# EasyEDA Pro project d2-afe-development.epro, schematic Schematic1_1

## Sheets
1 ads1298: Board Name: Board1; Create Date: 2026-01-05; Page Name: P1; Project Name: ads1298; Schematic Name: Schematic1; Update Date: 2026-01-05; BladeWidth: 10; Company: 嘉立创EDA; Page Size: A4; RegionStart: 1; ShowBorder: 1; TitleBlock: 0; TitleBlockPosition: 3; Version: V1.0; XRegionCount: 6; YRegionCount: 4
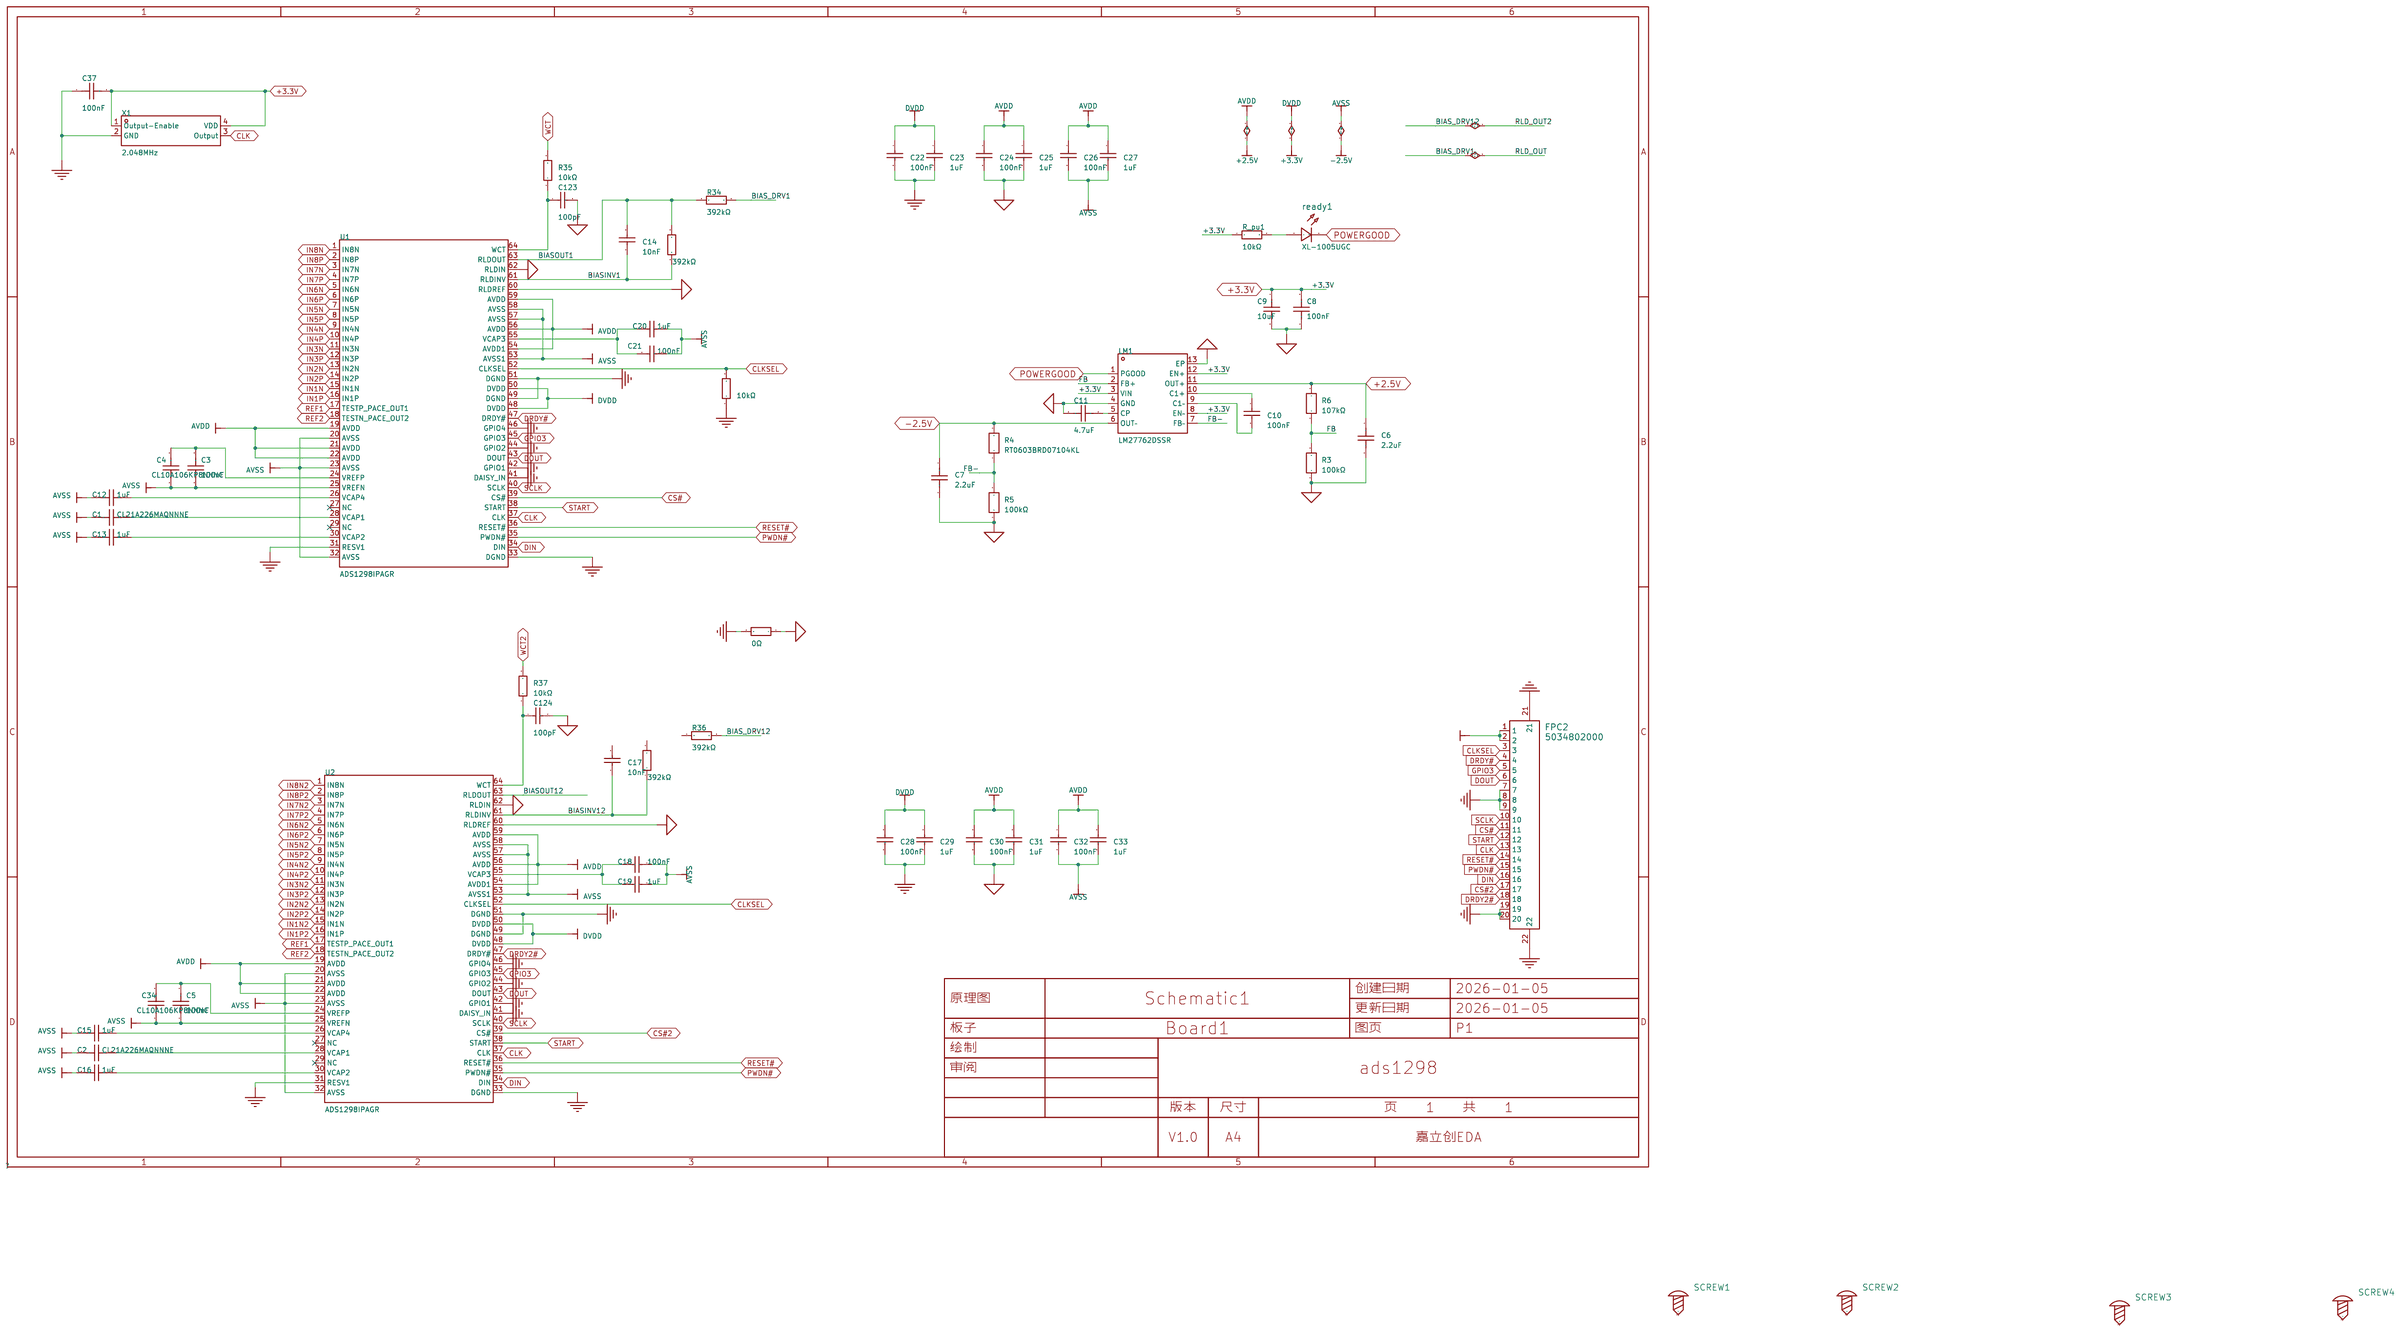
[diagram p0: ads1298]
2 power: Assembly Variant: Basic; Create Date: 2026-01-14; Update Date: 2026-01-14
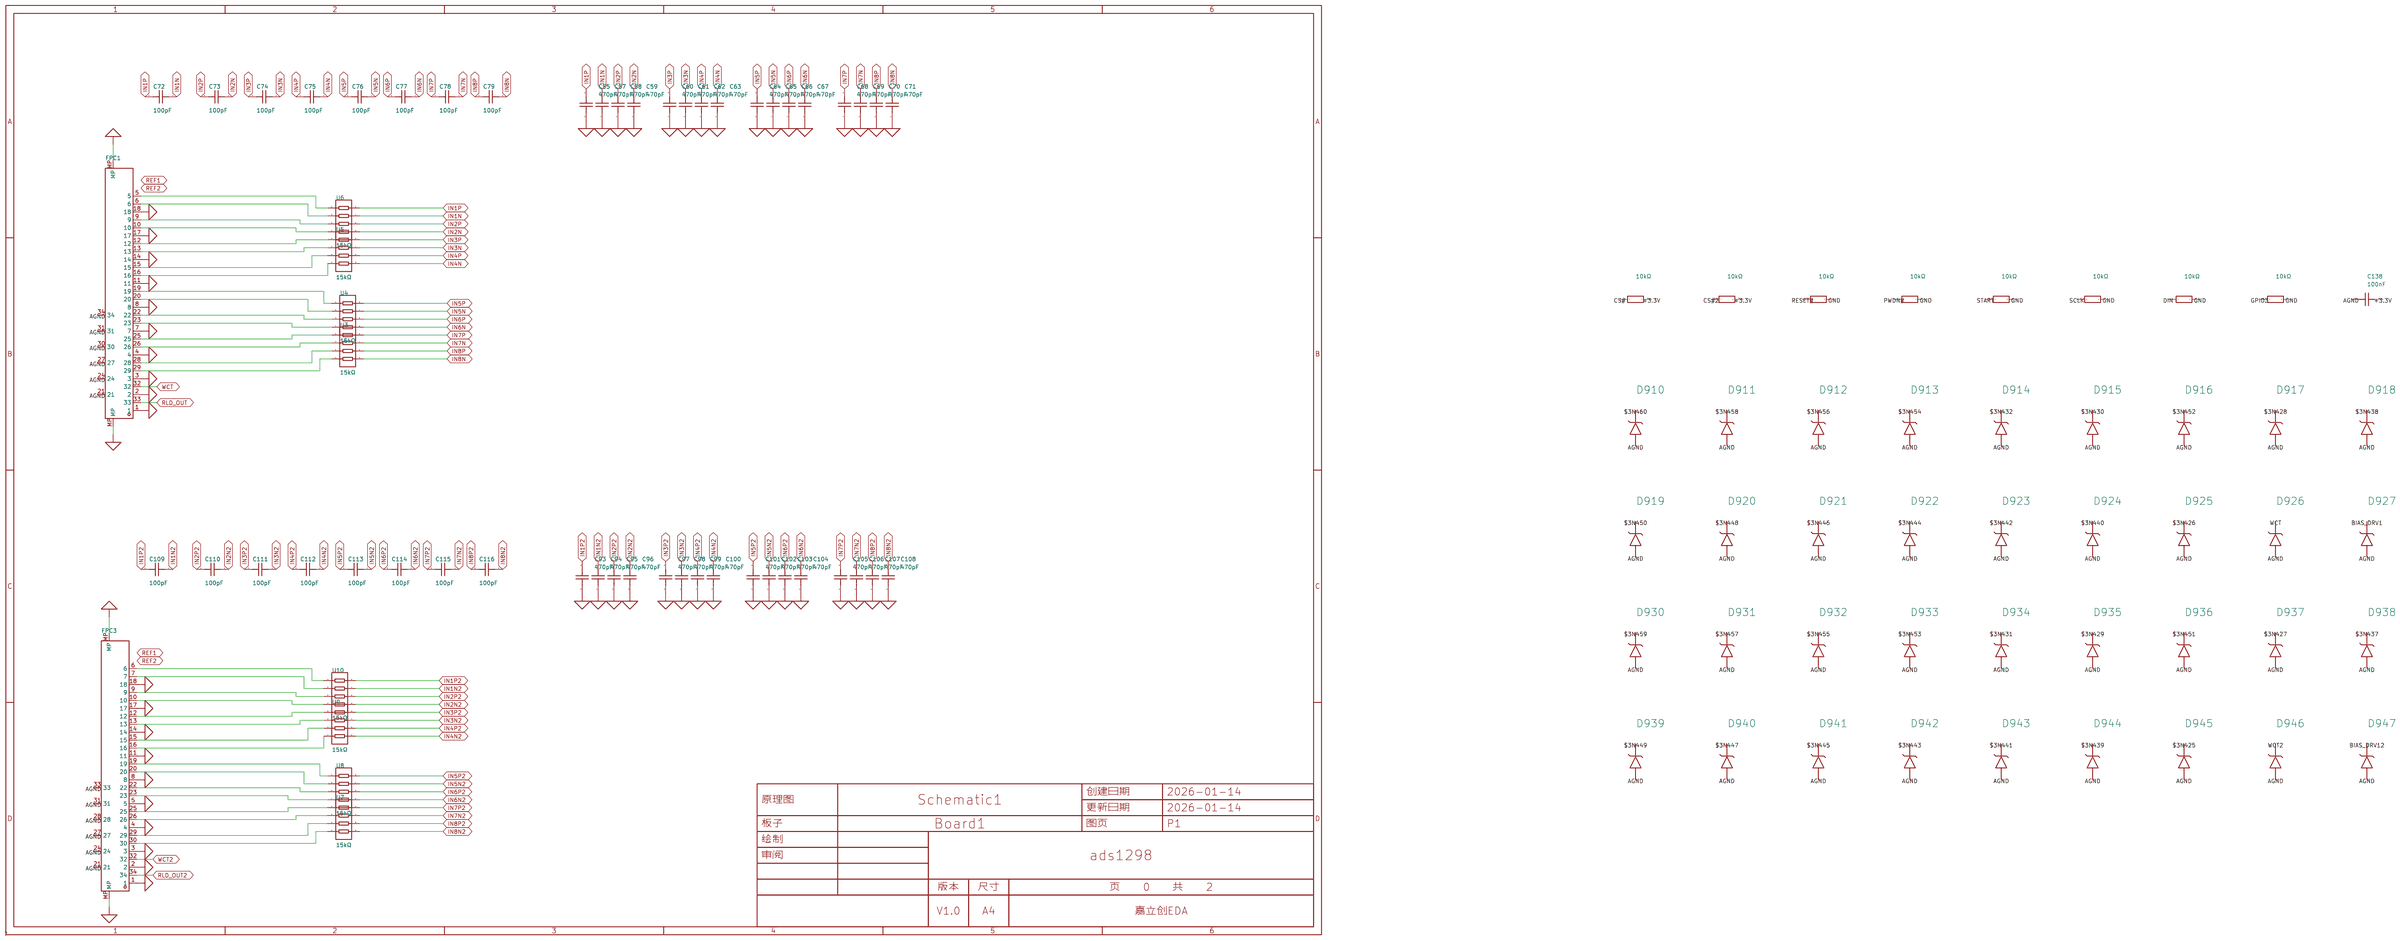
[diagram p1: power]

## Parts
sheet ads1298
C1  22uF  [C08A:V4_C54]
C2  22uF  [C08A:V4_C54]
C3  100nF  [C0402]
C4  10uF  [C08A:V4_C46]
C5  100nF  [C0402]
C6  2.2uF  [C0402]
C7  2.2uF  [C0402]
C8  100nF  [C0402]
C9  10uF  [C0402]
C10  100nF  [C0402]
C11  4.7uF  [C0402]
C12  1uF  [C0402]
C13  1uF  [C0402]
C14  10nF  [C0402]
C15  1uF  [C0402]
C16  1uF  [C0402]
C17  10nF  [C0402]
C18  100nF  [C0402]
C19  1uF  [C0402]
C20  1uF  [C0402]
C21  100nF  [C0402]
C22  100nF  [C0402]
C23  1uF  [C0402]
C24  100nF  [C0402]
C25  1uF  [C0402]
C26  100nF  [C0402]
C27  1uF  [C0402]
C28  100nF  [C0402]
C29  1uF  [C0402]
C30  100nF  [C0402]
C31  1uF  [C0402]
C32  100nF  [C0402]
C33  1uF  [C0402]
C34  10uF  [C08A:V4_C46]
C37  100nF  [C0402]
C123  100pF  [C0402]
C124  100pF  [C0402]
FPC2  5034802000  [FPC-SMD_5034802000]
LM1  LM27762DSSR  [WSON-12_L3.0-W2.0-P0.50-BL-EP]
R1  0Ω  [R0402]
R3  100kΩ  [R0402]
R4  104kΩ  [C08A:V4_R29]
R5  100kΩ  [R0402]
R6  107kΩ  [R0402]
R17  10kΩ  [R0402]
R24  392kΩ  [R0402]
R32  392kΩ  [R0402]
R34  392kΩ  [R0402]
R35  10kΩ  [R0402]
R36  392kΩ  [R0402]
R37  10kΩ  [R0402]
R_pu1  10kΩ  [R0402]
ready1  XL-1005UGC  [LED0402-RD_GREEN-1]
SCREW1  -  [M2螺丝]
SCREW2  -  [M2螺丝]
SCREW3  -  [M2螺丝]
SCREW4  -  [M2螺丝]
U1  ADS1298IPAGR  [TQFP-64_L10.0-W10.0-P0.50-LS12.0-BL]
U2  ADS1298IPAGR  [TQFP-64_L10.0-W10.0-P0.50-LS12.0-BL]
X1  2.048MHz  [OSC-SMD_4P-L1.6-W1.2-BL]
sheet power
C55  470pF  [C0201]
C57  470pF  [C0201]
C58  470pF  [C0201]
C59  470pF  [C0201]
C60  470pF  [C0201]
C61  470pF  [C0201]
C62  470pF  [C0201]
C63  470pF  [C0201]
C64  470pF  [C0201]
C65  470pF  [C0201]
C66  470pF  [C0201]
C67  470pF  [C0201]
C68  470pF  [C0201]
C69  470pF  [C0201]
C70  470pF  [C0201]
C71  470pF  [C0201]
C72  100pF  [C0201]
C73  100pF  [C0201]
C74  100pF  [C0201]
C75  100pF  [C0201]
C76  100pF  [C0201]
C77  100pF  [C0201]
C78  100pF  [C0201]
C79  100pF  [C0201]
C93  470pF  [C0201]
C94  470pF  [C0201]
C95  470pF  [C0201]
C96  470pF  [C0201]
C97  470pF  [C0201]
C98  470pF  [C0201]
C99  470pF  [C0201]
C100  470pF  [C0201]
C101  470pF  [C0201]
C102  470pF  [C0201]
C103  470pF  [C0201]
C104  470pF  [C0201]
C105  470pF  [C0201]
C106  470pF  [C0201]
C107  470pF  [C0201]
C108  470pF  [C0201]
C109  100pF  [C0201]
C110  100pF  [C0201]
C111  100pF  [C0201]
C112  100pF  [C0201]
C113  100pF  [C0201]
C114  100pF  [C0201]
C115  100pF  [C0201]
C116  100pF  [C0201]
C138  100nF  [C0402]
D910  ESD401DPYR  [C08A:D910]
D911  ESD401DPYR  [C08A:D910]
D912  ESD401DPYR  [C08A:D910]
D913  ESD401DPYR  [C08A:D910]
D914  ESD401DPYR  [C08A:D910]
D915  ESD401DPYR  [C08A:D910]
D916  ESD401DPYR  [C08A:D910]
D917  ESD401DPYR  [C08A:D910]
D918  ESD401DPYR  [C08A:D910]
D919  ESD401DPYR  [C08A:D910]
D920  ESD401DPYR  [C08A:D910]
D921  ESD401DPYR  [C08A:D910]
D922  ESD401DPYR  [C08A:D910]
D923  ESD401DPYR  [C08A:D910]
D924  ESD401DPYR  [C08A:D910]
D925  ESD401DPYR  [C08A:D910]
D926  ESD401DPYR  [C08A:D910]
D927  ESD401DPYR  [C08A:D910]
D930  ESD401DPYR  [C08A:D910]
D931  ESD401DPYR  [C08A:D910]
D932  ESD401DPYR  [C08A:D910]
D933  ESD401DPYR  [C08A:D910]
D934  ESD401DPYR  [C08A:D910]
D935  ESD401DPYR  [C08A:D910]
D936  ESD401DPYR  [C08A:D910]
D937  ESD401DPYR  [C08A:D910]
D938  ESD401DPYR  [C08A:D910]
D939  ESD401DPYR  [C08A:D910]
D940  ESD401DPYR  [C08A:D910]
D941  ESD401DPYR  [C08A:D910]
D942  ESD401DPYR  [C08A:D910]
D943  ESD401DPYR  [C08A:D910]
D944  ESD401DPYR  [C08A:D910]
D945  ESD401DPYR  [C08A:D910]
D946  ESD401DPYR  [C08A:D910]
D947  ESD401DPYR  [C08A:D910]
FPC1  FH34SRJ-34S-0.5SH(50)  [Hirose_FH34SRJ-34S-0.5SH]
FPC3  FH34SRJ-34S-0.5SH(50)  [Hirose_FH34SRJ-34S-0.5SH]
R801  10kΩ  [R0402]
R802  10kΩ  [R0402]
R803  10kΩ  [R0402]
R804  10kΩ  [R0402]
R805  10kΩ  [R0402]
R806  10kΩ  [R0402]
R807  10kΩ  [R0402]
R808  10kΩ  [R0402]
U3  15kΩ  [RES-ARRAY-SMD_0402-8P-L2.0-W1.0-BL]
U4  15kΩ  [RES-ARRAY-SMD_0402-8P-L2.0-W1.0-BL]
U5  15kΩ  [RES-ARRAY-SMD_0402-8P-L2.0-W1.0-BL]
U6  15kΩ  [RES-ARRAY-SMD_0402-8P-L2.0-W1.0-BL]
U7  15kΩ  [RES-ARRAY-SMD_0402-8P-L2.0-W1.0-BL]
U8  15kΩ  [RES-ARRAY-SMD_0402-8P-L2.0-W1.0-BL]
U9  15kΩ  [RES-ARRAY-SMD_0402-8P-L2.0-W1.0-BL]
U10  15kΩ  [RES-ARRAY-SMD_0402-8P-L2.0-W1.0-BL]

## Library data of the parts
C1 C2 = CL21A226MAQNNNE: Supplier Footprint: 0805; Supplier Part: C45783; Manufacturer: Samsung; Datasheet: https://www.lcsc.com/product-detail/C45783.html
C3 C5 C8 C37 C138 = CL05B104KO5NNNC: CL05B104KO5NNNC 100nF 0402; Supplier Footprint: 0402; Supplier Part: C1525; Supplier: LCSC; Datasheet: https://www.lcsc.com/product-detail/C1525.html; Manufacturer: Samsung; LCSC Part Name: 100nF 0402; Tolerance: ±10%; Voltage Rating: 16V; Temperature Coefficient: X7R
C4 C34 = CL10A106KP8NNNC: Supplier Footprint: 0603; Supplier Part: C19702; Manufacturer: Samsung; Datasheet: https://www.lcsc.com/product-detail/C19702.html
C6 C7 = CL05A225KO5NQNC: 容值:2.2uF;精度:±10%;额定电压:16V;温度系数:X5R;; LCSC Part Name: 2.2uF ±10% 16V; Supplier Part: C170151; Manufacturer: SAMSUNG(三星); Supplier Footprint: 0402; JLCPCB Part Class: Extended Part; Datasheet: https://item.szlcsc.com/datasheet/CL05A225KO5NQNC/181536.html; Supplier: LCSC; Tolerance: ±10%; Voltage Rating: 16V; Temperature Coefficient: X5R
C9 = HGC0402R5106M100NTEJ: HGC0402R5106M100NTEJ 10uF 0402; Supplier Footprint: 0402; Supplier Part: C7472949; Supplier: LCSC; Datasheet: https://www.lcsc.com/product-detail/C7472949.html; LCSC Part Name: 10uF 0402; Tolerance: ±20%; Voltage Rating: 10V; Temperature Coefficient: X5R
C10 C18 C21 C22 C24 C26 C28 C30 C32 = CL05B104KO5NNNC: CL05B104KO5NNNC 100nF 0402; LCSC Part Name: 100nF 0402; Supplier Part: C1525; Manufacturer: Samsung; Supplier Footprint: 0402; Datasheet: https://www.lcsc.com/product-detail/C1525.html; Supplier: LCSC; Tolerance: ±10%; Voltage Rating: 16V; Temperature Coefficient: X7R
C11 = CL05A475KP5NRNC: CL05A475KP5NRNC 4.7uF 0402; LCSC Part Name: 4.7uF 0402; Supplier Part: C368809; Manufacturer: Samsung; Supplier Footprint: 0402; Datasheet: https://www.lcsc.com/product-detail/C368809.html; Supplier: LCSC; Tolerance: ±10%; Voltage Rating: 10V; Temperature Coefficient: X5R
C12 C13 C15 C16 = CL05A105KA5NQNC: CL05A105KA5NQNC 1uF 0402; Supplier Footprint: 0402; Supplier Part: C52923; Supplier: LCSC; Datasheet: https://www.lcsc.com/product-detail/C52923.html; Manufacturer: Samsung; LCSC Part Name: 1uF 0402; Tolerance: ±10%; Voltage Rating: 25V; Temperature Coefficient: X5R
C14 C17 = 0402B103K500NT: 0402B103K500NT 10nF 0402; LCSC Part Name: 10nF 0402; Supplier Part: C1524; Manufacturer: FH; Supplier Footprint: 0402; Datasheet: https://www.lcsc.com/product-detail/C1524.html; Supplier: LCSC; Tolerance: ±10%; Voltage Rating: 50V; Temperature Coefficient: X7R
C19 C20 C23 C25 C27 C29 C31 C33 = CL05A105KA5NQNC: CL05A105KA5NQNC 1uF 0402; LCSC Part Name: 1uF 0402; Supplier Part: C52923; Manufacturer: Samsung; Supplier Footprint: 0402; Datasheet: https://www.lcsc.com/product-detail/C52923.html; Supplier: LCSC; Tolerance: ±10%; Voltage Rating: 25V; Temperature Coefficient: X5R
C123 C124 = 0402CG101J500NT: 容值:100pF;精度:±5%;额定电压:50V;温度系数:C0G;; LCSC Part Name: 100pF ±5% 50V; Supplier Part: C1546; Manufacturer: FH(风华); Supplier Footprint: 0402; JLCPCB Part Class: Basic Part; Datasheet: https://item.szlcsc.com/datasheet/0402CG101J500NT/1898.html; Supplier: LCSC; Tolerance: ±5%; Voltage Rating: 50V; Temperature Coefficient: C0G
FPC2 = 5034802000: 锁定特性:翻盖式;触点类型:双侧触点/上下接;触点数量:20P;间距:0.5mm;安装方式:卧贴;工作温度:-40℃~+85℃;; LCSC Part Name: 翻盖式 双侧触点/上下接 P数:20P 间距:0.5mm; Supplier Part: C234192; Manufacturer: MOLEX; Supplier Footprint: SMD,P=0.5mm,卧贴; JLCPCB Part Class: Extended Part; Datasheet: https://www.molex.com/content/dam/molex/molex-dot-com/products/automated/en-us/salesdrawingpdf/503/503480/5034802000_sd.pdf?inline; Supplier: LCSC; Locking Feature: 翻盖式; Contact Type: 双侧触点/上下接; Number of Contacts: 20P; Pitch: 0.5mm; Mounting Type: 卧贴; FFC, FCB Thickness: 0.3mm; Height Above Board: 1mm; Contact Material: 磷青铜; Contact Plating: 金; Operating Temperature: -40℃~+85℃; Rated Voltage (Max): 50V; Current Rating (Max): 500mA
LM1 = LM27762DSSR: LM27762 带有集成 LDO 的低噪声正负输出电荷泵; LCSC Part Name: 低噪声正负输出集成电荷泵加LDO; Supplier Part: C473398; Manufacturer: TI(德州仪器); Supplier Footprint: WSON-12-EP(2x3); JLCPCB Part Class: 扩展库; Datasheet: https://www.ti.com/cn/lit/gpn/lm27762; Supplier: LCSC
R1 = 0402WGF0000TCE: 0402WGF0000TCE 0Ω 0402; Supplier Footprint: 0402; Supplier Part: C17168; Supplier: LCSC; Datasheet: https://www.lcsc.com/product-detail/C17168.html; Manufacturer: UNI-ROYAL; LCSC Part Name: 0Ω 0402
R3 R5 = RT0402BRD07100KL: 电阻类型:薄膜电阻;阻值:100kΩ;精度:±0.1%;功率:62.5mW;最大工作电压:50V;温度系数:±25ppm/℃;; LCSC Part Name: 薄膜电阻 100kΩ ±0.1% 62.5mW; Supplier Part: C852472; Manufacturer: YAGEO(国巨); Supplier Footprint: 0402; JLCPCB Part Class: Extended Part; Datasheet: https://atta.szlcsc.com/upload/public/pdf/source/20210326/C852472_6283D268A9C33EA67274729CC55E28B1.pdf; Supplier: LCSC; Type: 薄膜电阻; Tolerance: ±0.1%; Power(Watts): 62.5mW; Overload Voltage (Max): 50V; Temperature Coefficient: ±25ppm/℃; Operating Temperature Range: -55℃~+155℃
R4 = RT0603BRD07104KL: Supplier Part: C861070; Manufacturer: YAGEO; Supplier Footprint: 0603; Datasheet: https://www.lcsc.com/product-detail/C861070.html; Supplier: LCSC; Type: 薄膜电阻; Tolerance: ±0.1%; Overload Voltage (Max): 50V; Operating Temperature Range: -55℃~+155℃
R6 = RT0402BRD07107KL: RT0402BRD07107KL 107kΩ 0402; LCSC Part Name: 107kΩ 0402; Supplier Part: C852477; Manufacturer: YAGEO; Supplier Footprint: 0402; Datasheet: https://www.lcsc.com/product-detail/C852477.html; Supplier: LCSC; Type: 薄膜电阻; Tolerance: ±0.1%; Overload Voltage (Max): 50V; Operating Temperature Range: -55℃~+155℃
R17 R35 R37 R801-R808 = 0402WGF1002TCE: 0402WGF1002TCE 10kΩ 0402; Supplier Footprint: 0402; Supplier Part: C25744; Supplier: LCSC; Datasheet: https://www.lcsc.com/product-detail/C25744.html; Manufacturer: UNI-ROYAL; LCSC Part Name: 10kΩ 0402; Tolerance: ±1%
R24 R32 R34 R36 = 0402WGF3923TCE: 0402WGF3923TCE 392kΩ 0402; Supplier Footprint: 0402; Supplier Part: C27007; Supplier: LCSC; Datasheet: https://www.lcsc.com/product-detail/C27007.html; Manufacturer: UNI-ROYAL; LCSC Part Name: 392kΩ 0402; Tolerance: ±1%
R_pu1 = 0402WGF1002TCE: 0402WGF1002TCE 10kΩ 0402; LCSC Part Name: 10kΩ 0402; Supplier Part: C25744; Manufacturer: UNI-ROYAL; Supplier Footprint: 0402; Datasheet: https://www.lcsc.com/product-detail/C25744.html; Supplier: LCSC; Type: 厚膜电阻; Tolerance: ±1%
ready1 = XL-1005UGC_C965793: 发光颜色:翠绿色;正向压降(Vf):3V;功率:80mW;正向电流:25mA;波长:516nm~531nm;透镜颜色:无色透明透镜;色温:-;发光强度:249mcd;发光角度:120°;载带方式:正贴;工作温度:-40℃~+85℃;; LCSC Part Name: 0402翠绿贴片式发光二极管; Supplier Part: C965793; Manufacturer: XINGLIGHT(成兴光); Supplier Footprint: 0402; JLCPCB Part Class: Extended Part; Datasheet: https://item.szlcsc.com/datasheet/XL-1005UGC/1051402.html; Supplier: LCSC; Illumination Color: 翠绿色; Voltage - Forward(Vf): 3V; Power(Watts): 80mW; Forward Current: 25mA; Wavelength - Dominant: 516nm~531nm; Peak Wavelength: 531nm; Lens Color: 无色透明透镜; Luminous Intensity: 249mcd; Viewing Angle: 120°; Mounting Style: 正贴; Operating Temperature: -40℃~+85℃
SCREW1-SCREW4 = M2螺丝: Supplier Footprint: 插件
U1 U2 = ADS1298IPAGR: 电源电压:1.65V~3.6V；2.7V~5.5V;; LCSC Part Name: ADS1298R低功耗8通道24bit 生物电bit 测量模拟前端; Supplier Part: C527440; Manufacturer: TI(德州仪器); Supplier Footprint: TQFP-64(10x10); JLCPCB Part Class: 扩展库; Datasheet: https://www.ti.com/cn/lit/gpn/ads1298; Supplier: LCSC; Supply Voltage: 1.65V~3.6V；2.7V~5.5V
X1 = SWOFCVXXE8-2.048000: 频率:2.048MHz;输出模式:CMOS;工作电压:1.8V~3.3V;供电电流:10mA;频率稳定度:±25ppm;; Supplier Part: C22368484; Manufacturer: Starwave(思大); Supplier Footprint: SMD1612-4P; JLCPCB Part Class: Extended Part; Datasheet: https://atta.szlcsc.com/upload/public/pdf/source/20240327/D858014EAF94412D0C19E3A7F15830C6.pdf; Supplier: LCSC; Output Type: CMOS; Supply Voltage: 1.8V~3.3V; Supply Current (Max): 10mA; Frequency Stability: ±25ppm; Operating Temperature: -40℃~+85℃
C55 C57-C71 C93-C108 = GRM0335C1E471GA01D: 容值:470pF;精度:±2%;额定电压:25V;材质(温度系数):C0G;; LCSC Part Name: 470pF ±2% 25V; Supplier Part: C384950; Manufacturer: muRata(村田); Supplier Footprint: 0201; JLCPCB Part Class: Extended Part; Datasheet: https://atta.szlcsc.com/upload/public/pdf/source/20200305/C490387_23319AE8C154DEB24C505E6C82A8106A.pdf; Supplier: LCSC; Tolerance: ±2%; Voltage Rated: 25V; Temperature Coefficient: C0G
C72-C79 C109-C116 = GRM0335C1H101JA01D: GRM0335C1H101JA01D 100pF 0201; LCSC Part Name: 100pF 0201; Supplier Part: C76922; Manufacturer: Murata; Supplier Footprint: 0201; Datasheet: https://www.lcsc.com/product-detail/C76922.html; Supplier: LCSC; Tolerance: ±5%; Voltage Rating: 50V; Temperature Coefficient: C0G
D910-D927 D930-D947 = ESD401DPYR: LCSC: C1974752; Supplier Part: C1974752; Supplier: LCSC; Manufacturer: Texas Instruments; PCB Layer: TopLayer; Origin 3D Model Title: Texas_DPY0002A_0.6x1mm_P0.65mm; Footprints: []; Devices: []; pinClass: [object Object]; differentialPairClass: [object Object]; Symbols: []
FPC1 FPC3 = FH34SRJ-34S-0.5SH(50): D2 34P; Supplier Part: C424660; Manufacturer: Hirose; Supplier Footprint: SMD,P=0.5mm,卧贴; JLCPCB Part Class: Extended Part; Supplier: LCSC; Locking Feature: 翻盖式; Number of Contacts: 34P; Pitch: 0.5mm; FFC, FCB Thickness: 0.3mm; Contact Material: 磷青铜; Contact Plating: 锡; Operating Temperature: -25℃~+85℃; Rated Voltage (Max): 50V; Current Rating (Max): 500mA
U3-U10 = YC124-JR-0715KL: 电阻器数:4;阻值:15kΩ;精度:±5%;单个元件功率:62.5mW;温度系数:±200ppm/℃;; LCSC Part Name: 15kΩ ±5%; Supplier Part: C728762; Manufacturer: YAGEO(国巨); Supplier Footprint: 0402x4; JLCPCB Part Class: Extended Part; Datasheet: https://item.szlcsc.com/datasheet/YC124-JR-0715KL/776077.html; Supplier: LCSC; Number of Resistors: 4; Tolerance: ±5%; Power(Watts): 62.5mW; Temperature Coefficient: ±200ppm/℃; Number of Pins: 8

## Nets
+2.5V: C6.1 C24.1 C25.1 C26.1 C27.1 C30.1 C31.1 C32.1 C33.1 LM1.11(OUT+) R6.2 U1.19(AVDD) U1.21(AVDD) U1.22(AVDD) U1.54(AVDD1) U1.56(AVDD) U1.59(AVDD) U2.19(AVDD) U2.21(AVDD) U2.22(AVDD) U2.54(AVDD1) U2.56(AVDD) U2.59(AVDD)
+3.3V: C8.2 C9.1 C22.1 C23.1 C28.1 C29.1 C37.2 C138.2 FPC2.1 FPC2.2 LM1.3(VIN) LM1.8(EN–) LM1.12(EN+) R801.2 R802.2 R_pu1.1 U1.48(DVDD) U1.50(DVDD) U2.48(DVDD) U2.50(DVDD) X1.1(Output-Enable) X1.4(VDD)
-2.5V: C1.2 C2.2 C3.1 C4.1 C5.1 C7.1 C12.2 C13.2 C15.2 C16.2 C18.1 C19.1 C20.1 C21.1 C26.2 C27.2 C32.2 C33.2 C34.1 LM1.6(OUT–) R4.2 U1.20(AVSS) U1.23(AVSS) U1.25(VREFN) U1.32(AVSS) U1.53(AVSS1) U1.57(AVSS) U1.58(AVSS) U2.20(AVSS) U2.23(AVSS) U2.25(VREFN) U2.32(AVSS) U2.53(AVSS1) U2.57(AVSS) U2.58(AVSS)
AGND: C6.2 C7.2 C8.1 C9.2 C11.1 C24.2 C25.2 C30.2 C31.2 C55.1 C57.1 C58.1 C59.1 C60.1 C61.1 C62.1 C63.1 C64.1 C65.1 C66.1 C67.1 C68.1 C69.1 C70.1 C71.1 C93.1 C94.1 C95.1 C96.1 C97.1 C98.1 C99.1 C100.1 C101.1 C102.1 C103.1 C104.1 C105.1 C106.1 C107.1 C108.1 C123.2 C124.2 C138.1 D910.2 D911.2 D912.2 D913.2 D914.2 D915.2 D916.2 D917.2 D918.2 D919.2 D920.2 D921.2 D922.2 D923.2 D924.2 D925.2 D926.2 D927.2 D930.2 D931.2 D932.2 D933.2 D934.2 D935.2 D936.2 D937.2 D938.2 D939.2 D940.2 D941.2 D942.2 D943.2 D944.2 D945.2 D946.2 D947.2 FPC1.1 FPC1.2 FPC1.3 FPC1.4 FPC1.7 FPC1.8 FPC1.11 FPC1.14 FPC1.17 FPC1.18 FPC1.21 FPC1.24 FPC1.27 FPC1.30 FPC1.31 FPC1.34 FPC1.MP FPC3.1 FPC3.2 FPC3.3 FPC3.4 FPC3.5 FPC3.8 FPC3.11 FPC3.14 FPC3.17 FPC3.18 FPC3.21 FPC3.24 FPC3.27 FPC3.28 FPC3.31 FPC3.33 FPC3.MP LM1.4(GND) LM1.13(EP) R1.1 R3.1 R5.1 U1.60(RLDREF) U1.62(RLDIN) U2.60(RLDREF) U2.62(RLDIN)
GND: C22.2 C23.2 C28.2 C29.2 C37.1 FPC2.7 FPC2.8 FPC2.9 FPC2.19 FPC2.20 FPC2.21 FPC2.22 R1.2 R17.1 R803.2 R804.2 R805.2 R806.2 R807.2 R808.2 U1.31(RESV1) U1.33(DGND) U1.41(DAISY_IN) U1.42(GPIO1) U1.44(GPIO2) U1.46(GPIO4) U1.49(DGND) U1.51(DGND) U2.31(RESV1) U2.33(DGND) U2.41(DAISY_IN) U2.42(GPIO1) U2.44(GPIO2) U2.46(GPIO4) U2.49(DGND) U2.51(DGND) X1.2(GND)
BIAS_DRV1: D927.1 FPC1.33 R34.2
BIAS_DRV12: D947.1 FPC3.34 R36.2
BIASINV1: C14.1 R24.1 U1.61(RLDINV)
BIASINV12: C17.1 R32.1 U2.61(RLDINV)
BIASOUT1: C14.2 R24.2 R34.1 U1.63(RLDOUT)
BIASOUT12: C17.2 R32.2 R36.1 U2.63(RLDOUT)
CLK: FPC2.13 U1.37(CLK) U2.37(CLK) X1.3(Output)
CLKSEL: FPC2.3 R17.2 U1.52(CLKSEL) U2.52(CLKSEL)
CS#: FPC2.11 R801.1 U1.39(CS#)
CS#2: FPC2.17 R802.1 U2.39(CS#)
DIN: FPC2.16 R807.1 U1.34(DIN) U2.34(DIN)
DOUT: FPC2.6 U1.43(DOUT) U2.43(DOUT)
DRDY2#: FPC2.18 U2.47(DRDY#)
DRDY#: FPC2.4 U1.47(DRDY#)
FB: LM1.2(FB+) R3.2 R6.1
FB-: LM1.7(FB–) R4.1 R5.2
GPIO3: FPC2.5 R808.1 U1.45(GPIO3) U2.45(GPIO3)
IN1N: C57.2 C72.1 U1.15(IN1N) U6.7
IN1N2: C94.2 C109.1 U2.15(IN1N) U10.7
IN1P: C55.2 C72.2 U1.16(IN1P) U6.8
IN1P2: C93.2 C109.2 U2.16(IN1P) U10.8
IN2N: C59.2 C73.1 U1.13(IN2N) U6.5
IN2N2: C96.2 C110.1 U2.13(IN2N) U10.5
IN2P: C58.2 C73.2 U1.14(IN2P) U6.6
IN2P2: C95.2 C110.2 U2.14(IN2P) U10.6
IN3N: C61.2 C74.1 U1.11(IN3N) U5.7
IN3N2: C98.2 C111.1 U2.11(IN3N) U9.7
IN3P: C60.2 C74.2 U1.12(IN3P) U5.8
IN3P2: C97.2 C111.2 U2.12(IN3P) U9.8
IN4N: C63.2 C75.1 U1.9(IN4N) U5.5
IN4N2: C100.2 C112.1 U2.9(IN4N) U9.5
IN4P: C62.2 C75.2 U1.10(IN4P) U5.6
IN4P2: C99.2 C112.2 U2.10(IN4P) U9.6
IN5N: C65.2 C76.1 U1.7(IN5N) U4.7
IN5N2: C102.2 C113.1 U2.7(IN5N) U8.7
IN5P: C64.2 C76.2 U1.8(IN5P) U4.8
IN5P2: C101.2 C113.2 U2.8(IN5P) U8.8
IN6N: C67.2 C77.1 U1.5(IN6N) U4.5
IN6N2: C104.2 C114.1 U2.5(IN6N) U8.5
IN6P: C66.2 C77.2 U1.6(IN6P) U4.6
IN6P2: C103.2 C114.2 U2.6(IN6P) U8.6
IN7N: C69.2 C78.1 U1.3(IN7N) U3.7
IN7N2: C106.2 C115.1 U2.3(IN7N) U7.7
IN7P: C68.2 C78.2 U1.4(IN7P) U3.8
IN7P2: C105.2 C115.2 U2.4(IN7P) U7.8
IN8N: C71.2 C79.1 U1.1(IN8N) U3.5
IN8N2: C108.2 C116.1 U2.1(IN8N) U7.5
IN8P: C70.2 C79.2 U1.2(IN8P) U3.6
IN8P2: C107.2 C116.2 U2.2(IN8P) U7.6
POWERGOOD: LM1.1(PGOOD) ready1.1(C)
PWDN#: FPC2.15 R804.1 U1.35(PWDN#) U2.35(PWDN#)
REF1: U1.17(TESTP_PACE_OUT1) U2.17(TESTP_PACE_OUT1)
REF2: U1.18(TESTN_PACE_OUT2) U2.18(TESTN_PACE_OUT2)
RESET#: FPC2.14 R803.1 U1.36(RESET#) U2.36(RESET#)
SCLK: FPC2.10 R806.1 U1.40(SCLK) U2.40(SCLK)
START: FPC2.12 R805.1 U1.38(START) U2.38(START)
WCT: D926.1 FPC1.32 R35.2
WCT2: D946.1 FPC3.32 R37.2
$1N19: C3.2 C4.2 U1.24(VREFP)
$1N24: C12.1 U1.26(VCAP4)
$1N26: C13.1 U1.30(VCAP2)
$1N44: C20.2 C21.2 U1.55(VCAP3)
$1N307: C16.1 U2.30(VCAP2)
$1N309: C15.1 U2.26(VCAP4)
$1N319: C5.2 C34.2 U2.24(VREFP)
$1N323: C18.2 C19.2 U2.55(VCAP3)
$1N350: C123.1 R35.1 U1.64(WCT)
$1N353: C124.1 R37.1 U2.64(WCT)
$1N354: C1.1 U1.28(VCAP1)
$1N355: C2.1 U2.28(VCAP1)
$1N379: C11.2 LM1.5(CP)
$1N387: C10.2 LM1.9(C1–)
$1N388: C10.1 LM1.10(C1+)
$1N399: R_pu1.2 ready1.2(A)
$3N425: D945.1 FPC3.30 U7.4
$3N426: D925.1 FPC1.29 U3.4
$3N427: D937.1 FPC3.16 U9.4
$3N428: D917.1 FPC1.16 U5.4
$3N429: D935.1 FPC3.13 U9.2
$3N430: D915.1 FPC1.13 U5.2
$3N431: D934.1 FPC3.12 U9.1
$3N432: D914.1 FPC1.12 U5.1
$3N437: D938.1 FPC3.19 U8.1
$3N438: D918.1 FPC1.19 U4.1
$3N439: D944.1 FPC3.29 U7.3
$3N440: D924.1 FPC1.28 U3.3
$3N441: D943.1 FPC3.26 U7.2
$3N442: D923.1 FPC1.26 U3.2
$3N443: D942.1 FPC3.25 U7.1
$3N444: D922.1 FPC1.25 U3.1
$3N445: D941.1 FPC3.23 U8.4
$3N446: D921.1 FPC1.23 U4.4
$3N447: D940.1 FPC3.22 U8.3
$3N448: D920.1 FPC1.22 U4.3
$3N449: D939.1 FPC3.20 U8.2
$3N450: D919.1 FPC1.20 U4.2
$3N451: D936.1 FPC3.15 U9.3
$3N452: D916.1 FPC1.15 U5.3
$3N453: D933.1 FPC3.10 U10.4
$3N454: D913.1 FPC1.10 U6.4
$3N455: D932.1 FPC3.9 U10.3
$3N456: D912.1 FPC1.9 U6.3
$3N457: D931.1 FPC3.7 U10.2
$3N458: D911.1 FPC1.6 U6.2
$3N459: D930.1 FPC3.6 U10.1
$3N460: D910.1 FPC1.5 U6.1

Not connected (* = marked no-connect by the designer): SCREW1 1; SCREW2 1; SCREW3 1; SCREW4 1; U1 27(NC)* 29(NC)*; U2 27(NC)* 29(NC)*
